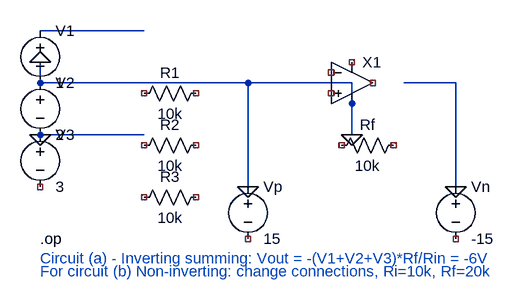
[diagram p0: schematic Ex06.asc]
Ex06.asc, the LTspice schematic file:
Version 4
SHEET 1 2240 1080
WIRE 80 160 80 128
WIRE 240 80 80 80
WIRE 240 160 80 160
WIRE 240 240 80 240
WIRE 400 160 240 160
WIRE 560 160 400 160
WIRE 720 160 640 160
WIRE 720 240 720 160
WIRE 560 240 560 160
WIRE 400 320 400 160
WIRE 720 320 720 240
FLAG 80 128 0
FLAG 80 240 0
FLAG 560 240 0
FLAG 720 320 0
FLAG 400 320 0
SYMBOL voltage 80 64 R0
WINDOW 123 0 0 Left 0
WINDOW 39 0 0 Left 0
SYMATTR InstName V1
SYMATTR Value 1
SYMBOL voltage 80 144 R0
WINDOW 123 0 0 Left 0
WINDOW 39 0 0 Left 0
SYMATTR InstName V2
SYMATTR Value 2
SYMBOL voltage 80 224 R0
WINDOW 123 0 0 Left 0
WINDOW 39 0 0 Left 0
SYMATTR InstName V3
SYMATTR Value 3
SYMBOL res 336 160 R90
WINDOW 0 0 56 VBottom 2
WINDOW 3 32 56 VTop 2
SYMATTR InstName R1
SYMATTR Value 10k
SYMBOL res 336 240 R90
WINDOW 0 0 56 VBottom 2
WINDOW 3 32 56 VTop 2
SYMATTR InstName R2
SYMATTR Value 10k
SYMBOL res 336 320 R90
WINDOW 0 0 56 VBottom 2
WINDOW 3 32 56 VTop 2
SYMATTR InstName R3
SYMATTR Value 10k
SYMBOL res 640 240 R90
WINDOW 0 0 56 VBottom 2
WINDOW 3 32 56 VTop 2
SYMATTR InstName Rf
SYMATTR Value 10k
SYMBOL Opamps\UniversalOpAmp2 560 160 R0
SYMATTR InstName X1
SYMBOL voltage 400 304 R0
WINDOW 123 0 0 Left 0
WINDOW 39 0 0 Left 0
SYMATTR InstName Vp
SYMATTR Value 15
SYMBOL voltage 720 304 R0
WINDOW 123 0 0 Left 0
WINDOW 39 0 0 Left 0
SYMATTR InstName Vn
SYMATTR Value -15
NET 400 160 inn
NET 560 160 inp
NET 720 160 out
TEXT 80 400 Left 2 !.op
TEXT 80 430 Left 2 ;Circuit (a) - Inverting summing: Vout = -(V1+V2+V3)*Rf/Rin = -6V
TEXT 80 450 Left 2 ;For circuit (b) Non-inverting: change connections, Ri=10k, Rf=20k

The netlist it stands for:
* Ex06.asc
V1 N001 0 1
V2 0 0 2
V3 0 NC_01 3
R1 NC_02 NC_03 10k
R2 NC_04 NC_05 10k
R3 NC_06 NC_07 10k
Rf NC_08 NC_09 10k
XX1 NC_10 NC_11 NC_12 0 NC_13 level2 Avol=1Meg GBW=10Meg Slew=10Meg Ilimit=25m Rail=0 Vos=0 En=0 Enk=0 In=0 Ink=0 Rin=500Meg  ; pins In+ In- V+ V- OUT
Vp 0 NC_14 15
Vn 0 NC_15 -15
.op
* Circuit (a) - Inverting summing: Vout = -(V1+V2+V3)*Rf/Rin = -6V
* For circuit (b) Non-inverting: change connections, Ri=10k, Rf=20k
.lib UniversalOpAmp2.lib
.backanno
.end